# EAGLE design Sensor-node_med (EAGLE 9.6.2)
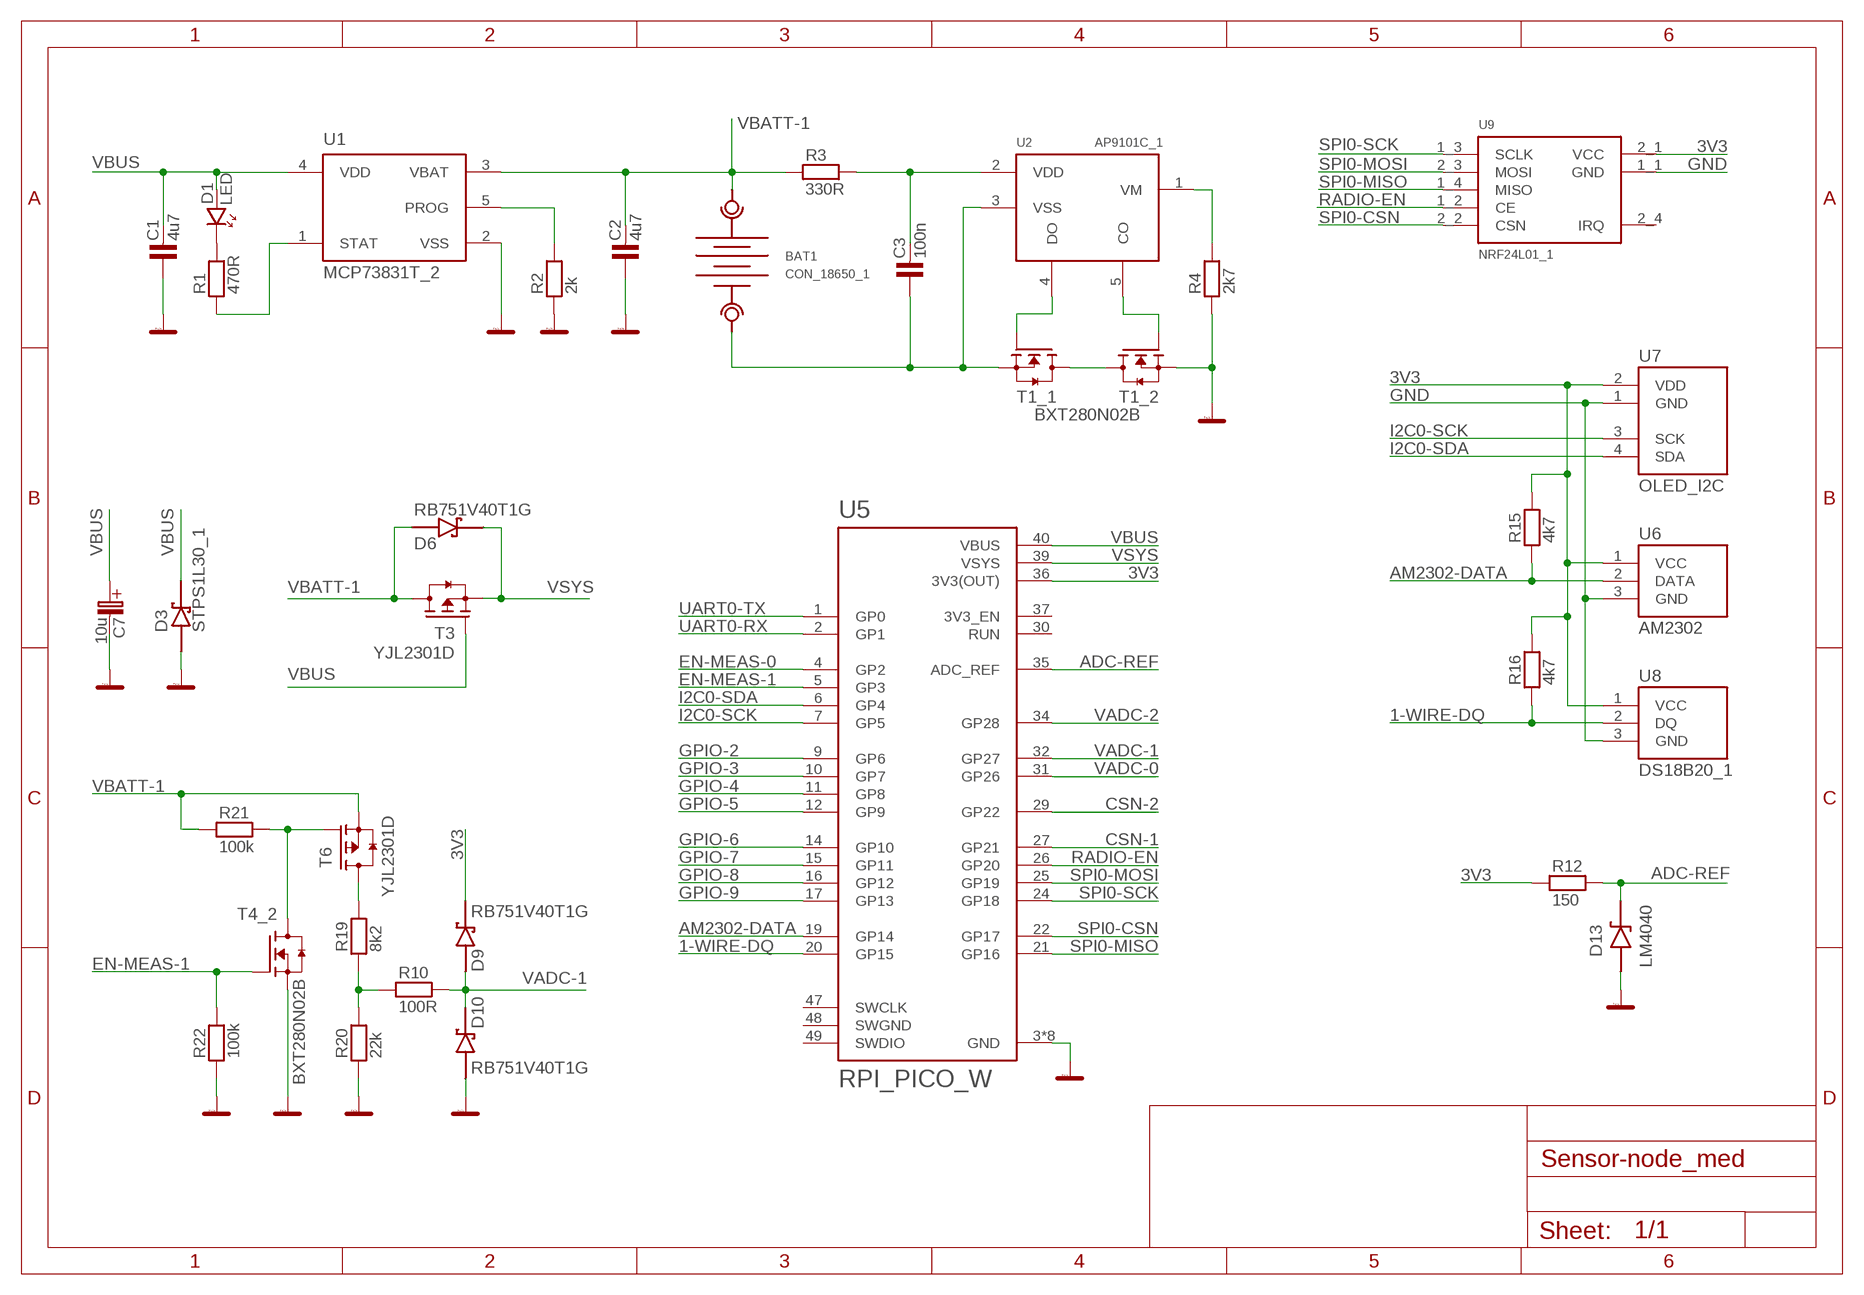
[diagram p0: schematic, sheet 1]

## Parts
BAT1  CON_18650_1  [BATTERY_PADS_1]
C1  4u7  C_KER_0805  [0805]
C2  4u7  C_KER_0805  [0805]
C3  100n  C_KER_0805  [0805]
C7  10u  C_EL_SMDD  [C_EL-SMD_D]
D1  LED  LED_1206  [P1206]
D3  STPS1L30_1  [SMA]
D6  RB751V40T1G  [SOD323]
D9  RB751V40T1G  [SOD323]
D10  RB751V40T1G  [SOD323]
D13  LM4040  [TRANSISTOR-FET_SOT23]
R1  470R  R_0805  [0805]
R2  2k  R_0805  [0805]
R3  330R  R_0805  [0805]
R4  2k7  R_0805  [0805]
R10  100R  R_0805  [0805]
R12  150  R_0805  [0805]
R15  4k7  R_0805  [0805]
R16  4k7  R_0805  [0805]
R19  8k2  R_0805  [0805]
R20  22k  R_0805  [0805]
R21  100k  R_0805  [0805]
R22  100k  R_0805  [0805]
T1  BXT280N02B  [SO8]
T3  YJL2301D  [TRANSISTOR-FET_SOT23]
T4  BXT280N02B  [SO8]
T6  YJL2301D  [TRANSISTOR-FET_SOT23]
U1  MCP73831T_2  [GHI-IC_SOT23-5(MICROCHIP)]
U2  AP9101C_1  [GHI-IC_SOT23-5(MICROCHIP)]
U5  RPI_PICO_W  RASPBERRY_PICO_W_2  [RPI_PICO_W]
U6  AM2302  [AM2302]
U7  OLED_I2C  [I2C_CONN]
U8  DS18B20_1  [DS18B20_CABLE]
U9  NRF24L01_1  [NRF24L01_NORM]

## Nets
1-WIRE-DQ: R16.1 U5.20(GP15) U8.2(DQ)
3V3: D9.1(C) R12.1 R15.2 R16.2 U5.36(3V3(OUT)) U6.1(VCC) U7.2(VDD) U8.1(VCC) U9.2_1(VCC)
ADC-REF: D13.1(C) R12.2 U5.35(ADC_REF)
AM2302-DATA: R15.1 U5.19(GP14) U6.2(DATA)
CO1: T1.2(_2:G) U2.5(CO)
CSN-1: U5.27(GP21)
CSN-2: U5.29(GP22)
DO1: T1.4(_1:G) U2.4(DO)
EN-MEAS-0: U5.4(GP2)
EN-MEAS-1: R22.2 T4.2(_2:G) U5.5(GP3)
GND: C1.1 C2.1 C7.-(C_EL-) D3.2(A) D10.2(A) D13.2(A) R2.1 R4.1 R20.1 R22.1 T1.1(_2:S) T4.1(_2:S) U1.2(VSS) U5.3(GND) U5.8(GND) U5.13(GND) U5.18(GND) U5.23(GND) U5.28(GND) U5.33(GND) U5.38(GND) U6.3(GND) U7.1(GND) U8.3(GND) U9.1_1(GND)
GPIO-2: U5.9(GP6)
GPIO-3: U5.10(GP7)
GPIO-4: U5.11(GP8)
GPIO-5: U5.12(GP9)
GPIO-6: U5.14(GP10)
GPIO-7: U5.15(GP11)
GPIO-8: U5.16(GP12)
GPIO-9: U5.17(GP13)
I2C0-SCK: U5.7(GP5) U7.3(SCK)
I2C0-SDA: U5.6(GP4) U7.4(SDA)
N$1: D1.K R1.2
N$2: R21.2 T4.7(_2:D) T4.8(_2:D) T6.1(G)
N$3: R19.2 T6.3(D)
N$4: R10.1 R19.1 R20.2
NMOS-CONN-1: T1.5(_1:D) T1.6(_1:D) T1.7(_2:D) T1.8(_2:D)
P1-: BAT1.GND_1(GND) BAT1.GND_2(GND) C3.1 T1.3(_1:S) U2.3(VSS)
PROG1: R2.2 U1.5(PROG)
RADIO-EN: U5.26(GP20) U9.1_2(CE)
SPI0-CSN: U5.22(GP17) U9.2_2(CSN)
SPI0-MISO: U5.21(GP16) U9.1_4(MISO)
SPI0-MOSI: U5.25(GP19) U9.2_3(MOSI)
SPI0-SCK: U5.24(GP18) U9.1_3(SCLK)
STAT1: R1.1 U1.1(STAT)
UART0-RX: U5.2(GP1)
UART0-TX: U5.1(GP0)
VADC-0: U5.31(GP26)
VADC-1: D9.2(A) D10.1(C) R10.2 U5.32(GP27)
VADC-2: U5.34(GP28)
VBATT-1: BAT1.UCC_1(UCC) BAT1.UCC_2(UCC) C2.2 D6.2(A) R3.1 R21.1 T3.3(D) T6.2(S) U1.3(VBAT)
VBUS: C1.2 C7.+(C_EL+) D1.A D3.1(C) T3.1(G) U1.4(VDD) U5.40(VBUS)
VDD-AP9101-1: C3.2 R3.2 U2.2(VDD)
VM1: R4.2 U2.1(VM)
VSYS: D6.1(C) T3.2(S) U5.39(VSYS)
Unconnected: T4.3(_1:S) T4.4(_1:G) T4.5(_1:D) T4.6(_1:D) U5.30(RUN) U5.37(3V3_EN) U5.47(SWCLK) U5.49(SWDIO) U9.2_4(IRQ)

## Power pins joined to a net without a drawn wire
SWGND: U5.48(SWGND)

## Library data of the parts
BAT1 = #_NG_knihovna:CON_18650
C1-C3 = #_NG_knihovna:C_KER: Kondenzator - keramicky
C7 = #_NG_knihovna:C_EL_SMD
D1 = #_NG_knihovna:LED: LED - jednobarevna
D3 = #_NG_knihovna:STPS1L30
D6 D9 D10 = #_NG_knihovna:RB751V40T1G
D13 = #_NG_knihovna:LM4040
R1-R4 R10 R12 R15 R16 R19-R22 = #_NG_knihovna:R: Rezistor
T1 T4 = #_NG_knihovna:BXT280N02B
T3 T6 = #_NG_knihovna:YJL2301D
U1 = #_NG_knihovna:MCP73831T
U2 = #_NG_knihovna:AP9101C
U5 = #_NG_knihovna:RASPBERRY_PICO_W_2
U6 = #_NG_knihovna:AM2302
U7 = #_NG_knihovna:OLED_I2C
U8 = #_NG_knihovna:DS18B20
U9 = #_NG_knihovna:NRF24L01

## Net classes
0 default: clearance 0.205 mm

## Board
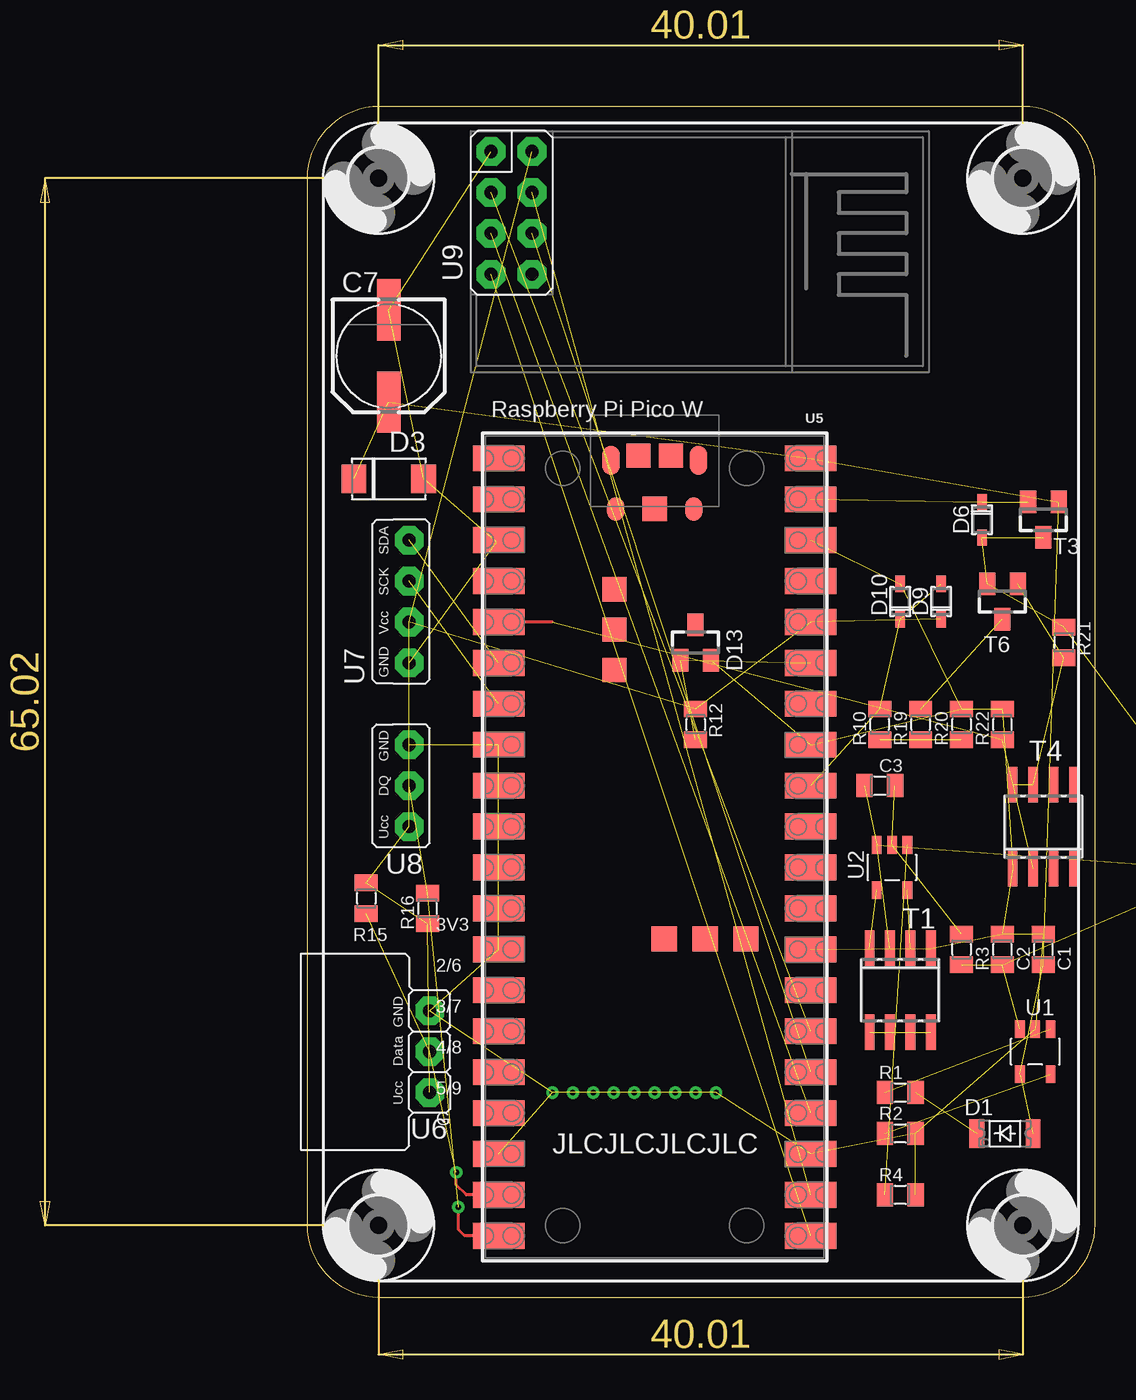
[diagram p1: board, top side]

Size 48.95 x 73.9 mm. Coordinates in mm from the lower left corner, seen from the top.
Outline: 0,69.42 0,4.5 arc90 4.5,0 44.4,0 arc90 48.95,4.55 48.95,69.42 arc90 44.46,73.9 4.48,73.9 arc90 0,69.42
Copper layers (1*16): Top 0.035mm / dielectric 1.5mm / Bottom 0.035mm
Design rules "default": minimum track width 6mil, minimum drill 0.35mm, track to track 6mil, track to pad 6mil, pad to pad 6mil, via to via 6mil, smd to smd 6mil, copper to edge 40mil, drill to drill 6mil, minimum pad ring 10mil, minimum via ring 8mil, stop-mask expansion 4mil, vias tented up to drill 0mil, thermal gap 10mil

### Footprints (pad centres in the part's own frame; a part is rotated, then mirrored left to right if it is on the bottom)
BATTERY_PADS_1 = smd 1.778 x 2.54: GND_1 1.27,0; UCC_1 -1.27,0 | drill 0.813 pad 1.676: GND_2 1.27,1.27; UCC_2 -1.27,1.27
0805 = smd 1.016 x 1.422: 1 -0.953,0; 2 0.953,0
C_EL-SMD_D = smd 3.81 x 1.473: + 2.857,0; - -2.857,0
P1206 = smd 0.914 x 1.778: A -1.905,0; K 1.587,0
SMA = smd 1.524 x 1.778: 1 -2.159,0; 2 2.159,0
SOD323 = smd 1 x 0.6: 1 -1.1,0; 2 1.1,0
TRANSISTOR-FET_SOT23 = smd 1 x 1.4: 1 -0.95,-1.1; 2 0.95,-1.1; 3 0,1.1
SO8 = smd 0.6 x 2.2: 1 -1.905,-2.6; 2 -0.635,-2.6; 3 0.635,-2.6; 4 1.905,-2.6; 5 1.905,2.6; 6 0.635,2.6; 7 -0.635,2.6; 8 -1.905,2.6
GHI-IC_SOT23-5(MICROCHIP) = smd 0.6 x 1.1: 1 -0.95,-1.4; 2 0,-1.4; 3 0.95,-1.4; 4 0.95,1.4; 5 -0.95,1.4
RPI_PICO_W = smd 3.2 x 1.6: 1 -9.69,24.13; 2 -9.69,21.59; 3 -9.69,19.05; 4 -9.69,16.51; 5 -9.69,13.97; 6 -9.69,11.43; 7 -9.69,8.89; 8 -9.69,6.35; 9 -9.69,3.81; 10 -9.69,1.27; 11 -9.69,-1.27; 12 -9.69,-3.81; 13 -9.69,-6.35; 14 -9.69,-8.89; 15 -9.69,-11.43; 16 -9.69,-13.97; 17 -9.69,-16.51; 18 -9.69,-19.05; 19 -9.69,-21.59; 20 -9.69,-24.13; 21 9.69,-24.13; 22 9.69,-21.59; 23 9.69,-19.05; 24 9.69,-16.51; 25 9.69,-13.97; 26 9.69,-11.43; 27 9.69,-8.89; 28 9.69,-6.35; 29 9.69,-3.81; 30 9.69,-1.27; 31 9.69,1.27; 32 9.69,3.81; 33 9.69,6.35; 34 9.69,8.89; 35 9.69,11.43; 36 9.69,13.97; 37 9.69,16.51; 38 9.69,19.05; 39 9.69,21.59; 40 9.69,24.13 | smd 1.5 x 1.5: 41 0,21; 42 1,24.3; 43 -1,24.3; 44 -2.5,16; 45 -2.5,13.5; 46 -2.5,11 | smd 1.575 x 1.575: 47 0.584,-5.7; 48 3.124,-5.7; 49 5.664,-5.7 | smd 1.1 x 1.8: A -2.725,24; B 2.725,24 | smd 1.05 x 1.45: C -2.425,20.97; D 2.425,20.97
AM2302 = drill 0.813 pad 1.778 octagon: 1 -2.54,0; 2 0,0; 3 2.54,0
I2C_CONN = drill 0.813 pad 1.778 octagon: 1 -3.81,0; 2 -1.27,0; 3 1.27,0; 4 3.81,0
DS18B20_CABLE = drill 0.813 pad 1.778 octagon: 1 -2.54,0; 2 0,0; 3 2.54,0
NRF24L01_NORM = drill 0.813 pad 1.778 octagon: 1_1 -3.81,-1.27; 1_2 -1.27,-1.27; 1_3 1.27,-1.27; 1_4 3.81,-1.27; 2_1 -3.81,1.27; 2_2 -1.27,1.27; 2_3 1.27,1.27; 2_4 3.81,1.27
3,6 = hole 3.6: 0,0

### Placement (x,y rotation side)
BAT1  55.88,27.94 180 top  (outside the outline)
C1  45.72,21.59 270 top
C2  43.18,21.59 270 top
C3  35.56,31.75 0 top
C7  5.08,58.42 270 top
D1  43.18,10.16 180 top
D3  5.08,50.8 0 top
D6  41.91,48.26 270 top
D9  39.37,43.18 90 top
D10  36.83,43.18 90 top
D13  24.13,40.64 0 top
R1  36.83,12.7 0 top
R2  36.83,10.16 180 top
R3  40.64,21.59 90 top
R4  36.83,6.35 180 top
R10  35.56,35.56 90 top
R12  24.13,35.56 270 top
R15  3.68,24.77 90 top
R16  7.49,24.13 270 top
R19  38.1,35.56 90 top
R20  40.64,35.56 270 top
R21  46.99,40.64 270 top
R22  43.18,35.56 270 top
T1  36.83,19.05 180 top
T3  45.72,48.26 180 top
T4  45.72,29.21 0 top
T6  43.18,43.18 180 top
U1  45.21,15.24 180 top
U2  36.32,26.67 180 top
U5  21.59,27.94 0 top
U6  7.62,15.24 90 top
U7  6.35,43.18 90 top
U8  6.35,31.75 90 top
U9  12.7,67.31 270 top
U$1  [3,6]  44.45,4.45 0 top
U$2  [3,6]  4.45,69.47 0 top
U$3  [3,6]  4.45,4.45 0 top
U$4  [3,6]  44.45,69.47 0 top

### Tracks (layer width: path | path; a pad name or v marks a point on that pad's centre or on a via)
1-WIRE-DQ  (via drill 0.35)  (2 unrouted)
  Top 0.2: U5.20 9.78,3.81 9.4,4.19 v9.4,5.59
3V3  (8 unrouted)
  Top 0.2: 39.41,42.04 D9.1
ADC-REF  (2 unrouted)
AM2302-DATA  (via drill 0.35)  (2 unrouted)
  Top 0.2: U5.19 9.91,6.35 9.27,6.99 v9.27,7.75
CO1  (1 unrouted)
DO1  (1 unrouted)
EN-MEAS-1  (2 unrouted)
  Top 0.2: 15.24,41.91 U5.5
GND  (via drill 0.35)  (33 unrouted)
  Top 0.2: U5.3 11.77,46.86 | D13.2 25.15,39.47
  other vias: 24.13,12.7 15.24,12.7 16.51,12.7 17.78,12.7 19.05,12.7 21.59,12.7 20.32,12.7 22.86,12.7 25.4,12.7
I2C0-SCK  (1 unrouted)
I2C0-SDA  (1 unrouted)
N$1  (1 unrouted)
N$2  (3 unrouted)
N$3  (1 unrouted)
N$4  (2 unrouted)
NMOS-CONN-1  (3 unrouted)
P1-  (4 unrouted)
PROG1  (1 unrouted)
RADIO-EN  (1 unrouted)
SPI0-CSN  (1 unrouted)
SPI0-MISO  (1 unrouted)
SPI0-MOSI  (1 unrouted)
SPI0-SCK  (1 unrouted)
STAT1  (1 unrouted)
VADC-1  (3 unrouted)
VBATT-1  (8 unrouted)
VBUS  (6 unrouted)
  Top 0.305: U1.4 44.32,13.78
VDD-AP9101-1  (2 unrouted)
VM1  (1 unrouted)
VSYS  (2 unrouted)

### Text on the board
tNames: Raspberry Pi Pico W | Sensor node max / v 1.0, 10/2023 | 3V3 | 2/6 | 3/7 | 4/8 | 5/9 | G | JLCJLCJLCJLC